# Altium project TP4_COMPACT_FMC.PrjPcb
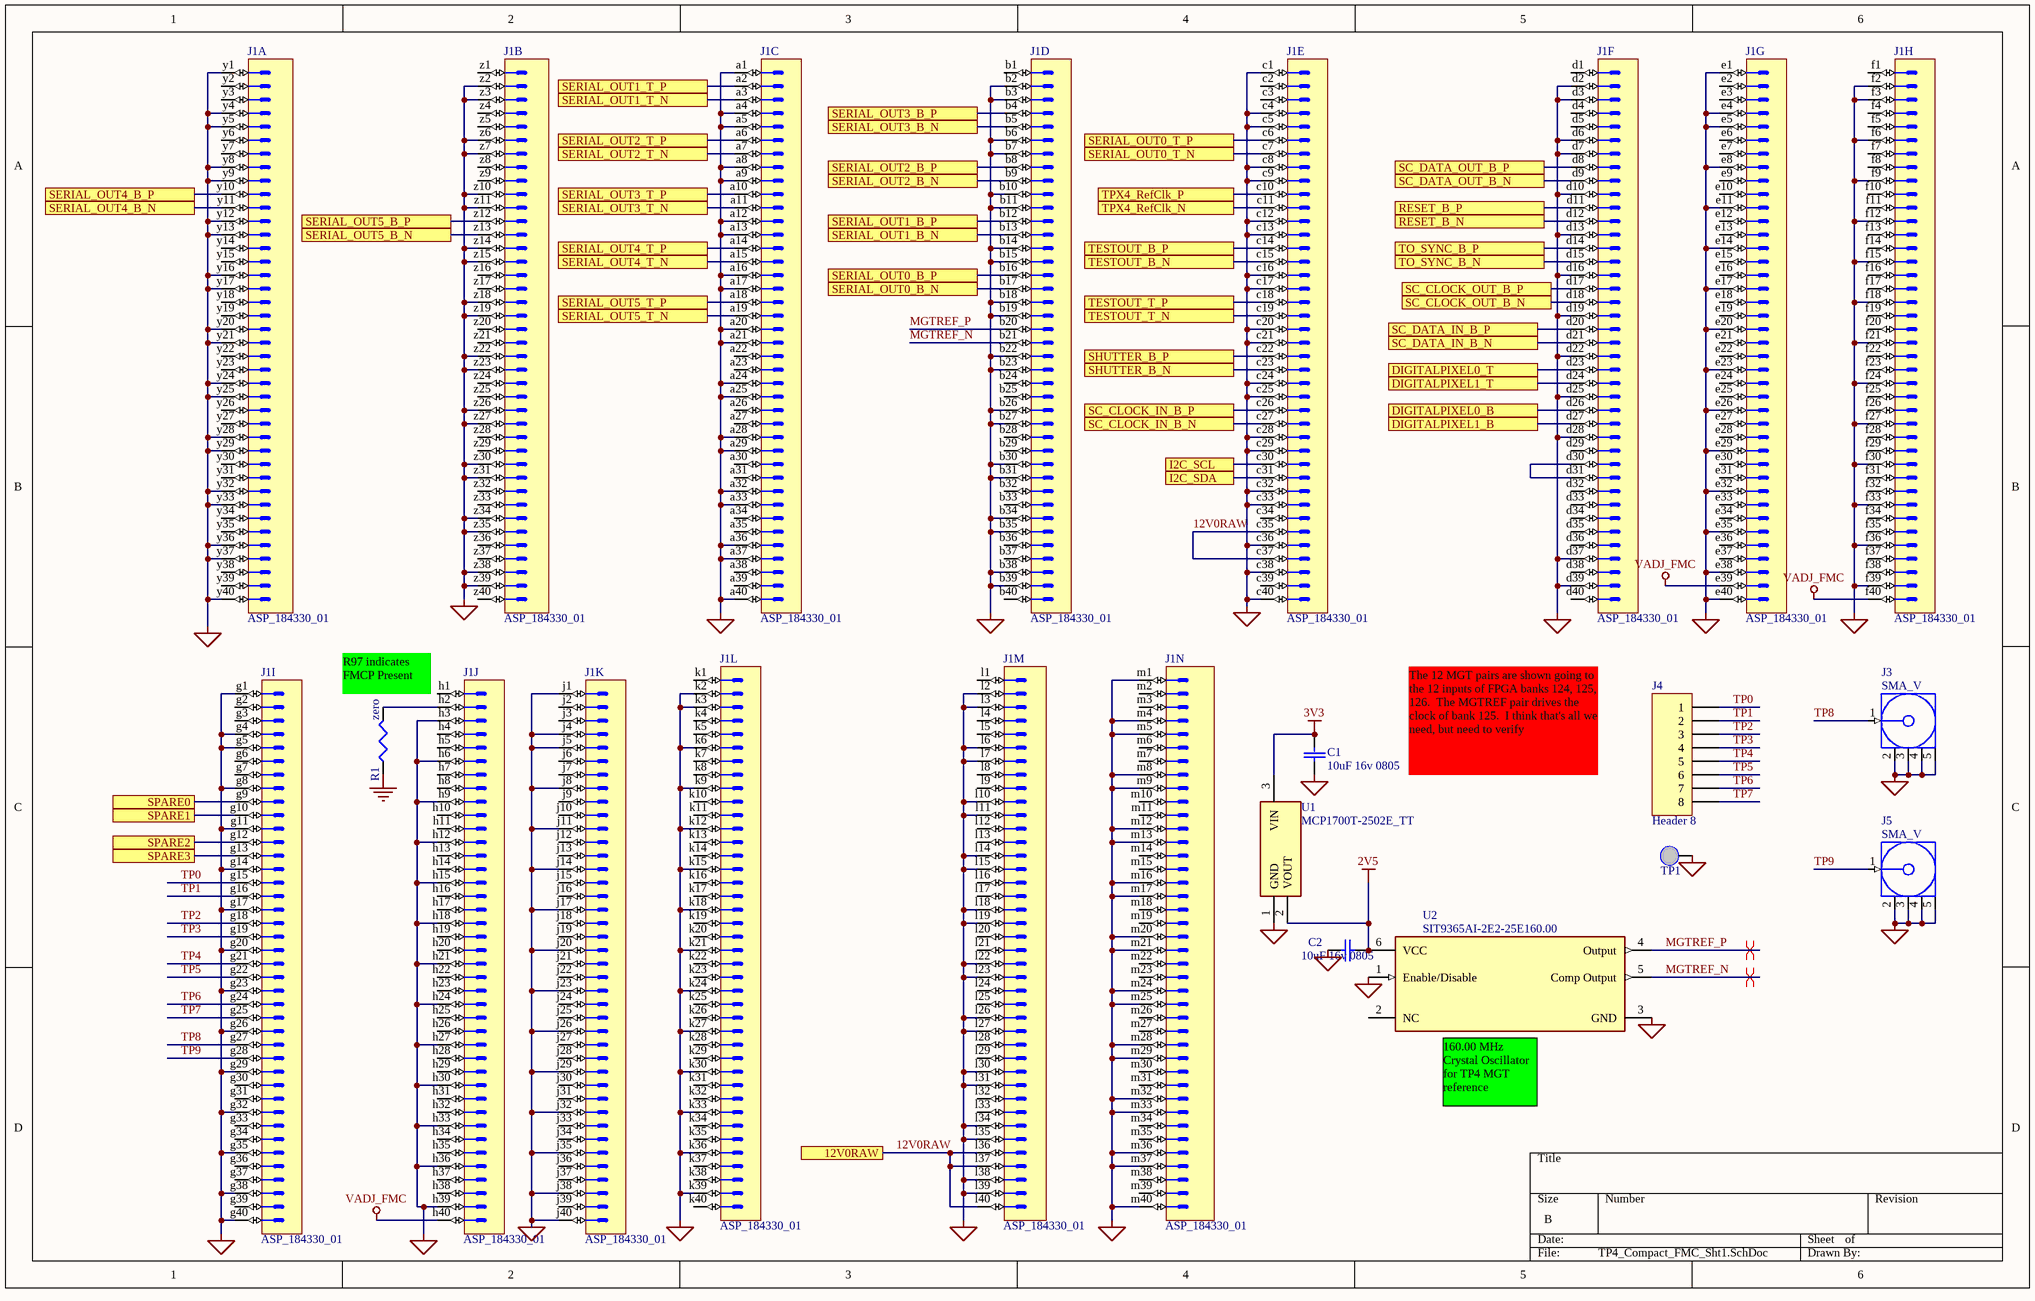
[diagram p0: TP4_Compact_FMC_Sht1.SchDoc]
2 sheets, 53 parts. Net scope: flat (ports and power ports of the same name join across sheets).
Board file: PCB1.PcbDoc
Sheets:
  TP4_Compact_FMC_Sht1.SchDoc
  TP4_Compact_FMC_Sht2.SchDoc

## Sheet TP4_Compact_FMC_Sht1.SchDoc
size B; SheetNumber: 1; SheetTotal: 2

### Parts
C1  value 10uF 16v 0805  [CAP0805]  (hidden comment: Cap)
C2  value 10uF 16v 0805  [CAP0805]  (hidden comment: Cap)
J1  ASP_184330_01  [SAMTEC_ASP_184330_01]  (parts A,B,C,D,E,F,G,H,I,J,K,L,M,N of 14)
J3  SMA_V  [SMA_Vert]
J4  Header 8  [HDR1X8]
J5  SMA_V  [SMA_Vert]
R1  value zero  [CAP0805]  (hidden comment: Res)
TP1  through-hole pad  [Pin1]  (value not drawn)
U1  MCP1700T-2502E_TT  [SOT95P237X112-3N]
U2  SIT9365AI-2E2-25E160.00  [osc_7mm_5mm]

### Ports
12V0RAW (see TP4_Compact_FMC_Sht2[1A]), DIGITALPIXEL0_B (see TP4_Compact_FMC_Sht2[6B]), DIGITALPIXEL0_T (see TP4_Compact_FMC_Sht2[6B]), DIGITALPIXEL1_B (see TP4_Compact_FMC_Sht2[6B]), DIGITALPIXEL1_T (see TP4_Compact_FMC_Sht2[6B]), I2C_SCL (see TP4_Compact_FMC_Sht2[4C]), I2C_SDA (see TP4_Compact_FMC_Sht2[6C]), RESET_B_N (see TP4_Compact_FMC_Sht2[4B]), RESET_B_P (see TP4_Compact_FMC_Sht2[4B]), SC_CLOCK_IN_B_N (see TP4_Compact_FMC_Sht2[4B]), SC_CLOCK_IN_B_P (see TP4_Compact_FMC_Sht2[4B]), SC_CLOCK_OUT_B_N (see TP4_Compact_FMC_Sht2[6B]), SC_CLOCK_OUT_B_P (see TP4_Compact_FMC_Sht2[6B]), SC_DATA_IN_B_N (see TP4_Compact_FMC_Sht2[6B]), SC_DATA_IN_B_P (see TP4_Compact_FMC_Sht2[6B]), SC_DATA_OUT_B_N (see TP4_Compact_FMC_Sht2[4B]), SC_DATA_OUT_B_P (see TP4_Compact_FMC_Sht2[4B]), SERIAL_OUT0_B_N (see TP4_Compact_FMC_Sht2[4A]), SERIAL_OUT0_B_P (see TP4_Compact_FMC_Sht2[4A]), SERIAL_OUT0_T_N (see TP4_Compact_FMC_Sht2[4A]), SERIAL_OUT0_T_P (see TP4_Compact_FMC_Sht2[4A]), SERIAL_OUT1_B_N (see TP4_Compact_FMC_Sht2[6A]), SERIAL_OUT1_B_P (see TP4_Compact_FMC_Sht2[6A]), SERIAL_OUT1_T_N (see TP4_Compact_FMC_Sht2[4A]), SERIAL_OUT1_T_P (see TP4_Compact_FMC_Sht2[4A]), SERIAL_OUT2_B_N (see TP4_Compact_FMC_Sht2[4A]), SERIAL_OUT2_B_P (see TP4_Compact_FMC_Sht2[4A]), SERIAL_OUT2_T_N (see TP4_Compact_FMC_Sht2[6A]), SERIAL_OUT2_T_P (see TP4_Compact_FMC_Sht2[6A]), SERIAL_OUT3_B_N (see TP4_Compact_FMC_Sht2[4A]), SERIAL_OUT3_B_P (see TP4_Compact_FMC_Sht2[4A]), SERIAL_OUT3_T_N (see TP4_Compact_FMC_Sht2[4A]), SERIAL_OUT3_T_P (see TP4_Compact_FMC_Sht2[4A]), SERIAL_OUT4_B_N (see TP4_Compact_FMC_Sht2[6A]), SERIAL_OUT4_B_P (see TP4_Compact_FMC_Sht2[6A]), SERIAL_OUT4_T_N (see TP4_Compact_FMC_Sht2[6A]), SERIAL_OUT4_T_P (see TP4_Compact_FMC_Sht2[6A]), SERIAL_OUT5_B_N (see TP4_Compact_FMC_Sht2[6A]), SERIAL_OUT5_B_P (see TP4_Compact_FMC_Sht2[6A]), SERIAL_OUT5_T_N (see TP4_Compact_FMC_Sht2[6A]), SERIAL_OUT5_T_P (see TP4_Compact_FMC_Sht2[6A]), SHUTTER_B_N (see TP4_Compact_FMC_Sht2[6B]), SHUTTER_B_P (see TP4_Compact_FMC_Sht2[6B]), SPARE0 (see TP4_Compact_FMC_Sht2[6B]), SPARE1 (see TP4_Compact_FMC_Sht2[6B]), SPARE2 (see TP4_Compact_FMC_Sht2[6B]), SPARE3 (see TP4_Compact_FMC_Sht2[6B]), TESTOUT_B_N (see TP4_Compact_FMC_Sht2[4B]), TESTOUT_B_P (see TP4_Compact_FMC_Sht2[4B]), TESTOUT_T_N (see TP4_Compact_FMC_Sht2[4B]), TESTOUT_T_P (see TP4_Compact_FMC_Sht2[4B]), TO_SYNC_B_N (see TP4_Compact_FMC_Sht2[4B]), TO_SYNC_B_P (see TP4_Compact_FMC_Sht2[4B]), TPX4_RefClk_N (see TP4_Compact_FMC_Sht2[4B]), TPX4_RefClk_P (see TP4_Compact_FMC_Sht2[4B])

### Nets
2V5: C2.1 U1.2(VOUT) U2.6(VCC)
3V3: C1.1 U1.3(VIN)
GND: C1.2 C2.2 J1.a1 J1.a4 J1.a5 J1.a8 J1.a9 J1.a12 J1.a13 J1.a16 J1.a17 J1.a20 J1.a21 J1.a24 J1.a25 J1.a28 J1.a29 J1.a32 J1.a33 J1.a36 J1.a37 J1.a40 J1.b2 J1.b3 J1.b6 J1.b7 J1.b10 J1.b11 J1.b14 J1.b15 J1.b18 J1.b19 J1.b22 J1.b23 J1.b26 J1.b27 J1.b30 J1.b31 J1.b34 J1.b35 J1.b38 J1.b39 J1.c1 J1.c4 J1.c5 J1.c8 J1.c9 J1.c12 J1.c13 J1.c16 J1.c17 J1.c20 J1.c21 J1.c24 J1.c25 J1.c28 J1.c29 J1.c32 J1.c33 J1.c36 J1.c38 J1.c40 J1.d2 J1.d3 J1.d6 J1.d7 J1.d10 J1.d13 J1.d16 J1.d19 J1.d22 J1.d25 J1.d28 J1.d37 J1.d39 J1.e1 J1.e4 J1.e5 J1.e8 J1.e11 J1.e14 J1.e17 J1.e20 J1.e23 J1.e26 J1.e29 J1.e32 J1.e35 J1.e38 J1.e40 J1.f2 J1.f3 J1.f6 J1.f9 J1.f12 J1.f15 J1.f18 J1.f21 J1.f24 J1.f27 J1.f30 J1.f33 J1.f36 J1.f39 J1.g1 J1.g4 J1.g5 J1.g8 J1.g11 J1.g14 J1.g17 J1.g20 J1.g23 J1.g26 J1.g29 J1.g32 J1.g35 J1.g38 J1.g40 J1.h3 J1.h6 J1.h9 J1.h12 J1.h15 J1.h18 J1.h21 J1.h24 J1.h27 J1.h30 J1.h33 J1.h36 J1.h39 J1.j1 J1.j4 J1.j5 J1.j8 J1.j11 J1.j14 J1.j17 J1.j20 J1.j23 J1.j26 J1.j29 J1.j32 J1.j35 J1.j38 J1.j40 J1.k2 J1.k3 J1.k6 J1.k9 J1.k12 J1.k15 J1.k18 J1.k21 J1.k24 J1.k27 J1.k30 J1.k33 J1.k36 J1.k39 J1.l2 J1.l3 J1.l6 J1.l7 J1.l10 J1.l11 J1.l14 J1.l15 J1.l18 J1.l19 J1.l22 J1.l23 J1.l26 J1.l27 J1.l30 J1.l31 J1.l34 J1.l35 J1.l38 J1.l39 J1.m1 J1.m4 J1.m5 J1.m8 J1.m9 J1.m12 J1.m13 J1.m16 J1.m17 J1.m20 J1.m21 J1.m24 J1.m25 J1.m28 J1.m29 J1.m32 J1.m33 J1.m36 J1.m37 J1.m40 J1.y1 J1.y4 J1.y5 J1.y8 J1.y9 J1.y12 J1.y13 J1.y16 J1.y17 J1.y20 J1.y21 J1.y24 J1.y25 J1.y28 J1.y29 J1.y32 J1.y33 J1.y36 J1.y37 J1.y40 J1.z2 J1.z3 J1.z6 J1.z7 J1.z10 J1.z11 J1.z14 J1.z15 J1.z18 J1.z19 J1.z22 J1.z23 J1.z26 J1.z27 J1.z30 J1.z31 J1.z34 J1.z35 J1.z38 J1.z39 J3.2(GND) J3.3(GND) J3.4(GND) J3.5(GND) J5.2(GND) J5.3(GND) J5.4(GND) J5.5(GND) R1.1 TP1.1 U1.1(GND) U2.1(Enable/Disable) U2.3(GND)
VADJ_FMC: J1.e39 J1.f40 J1.h40
12V0RAW: J1.c35 J1.c37 J1.l36 J1.l37 J1.l40 ; port 12V0RAW
DIGITALPIXEL0_B: J1.d26 ; port DIGITALPIXEL0_B
DIGITALPIXEL0_T: J1.d23 ; port DIGITALPIXEL0_T
DIGITALPIXEL1_B: J1.d27 ; port DIGITALPIXEL1_B
DIGITALPIXEL1_T: J1.d24 ; port DIGITALPIXEL1_T
I2C_SCL: J1.c30 ; port I2C_SCL
I2C_SDA: J1.c31 ; port I2C_SDA
MGTREF_N: J1.b21 U2.5(Comp_Output)
MGTREF_P: J1.b20 U2.4(Output)
RESET_B_N: J1.d12 ; port RESET_B_N
RESET_B_P: J1.d11 ; port RESET_B_P
SC_CLOCK_IN_B_N: J1.c27 ; port SC_CLOCK_IN_B_N
SC_CLOCK_IN_B_P: J1.c26 ; port SC_CLOCK_IN_B_P
SC_CLOCK_OUT_B_N: J1.d18 ; port SC_CLOCK_OUT_B_N
SC_CLOCK_OUT_B_P: J1.d17 ; port SC_CLOCK_OUT_B_P
SC_DATA_IN_B_N: J1.d21 ; port SC_DATA_IN_B_N
SC_DATA_IN_B_P: J1.d20 ; port SC_DATA_IN_B_P
SC_DATA_OUT_B_N: J1.d9 ; port SC_DATA_OUT_B_N
SC_DATA_OUT_B_P: J1.d8 ; port SC_DATA_OUT_B_P
SERIAL_OUT0_B_N: J1.b17 ; port SERIAL_OUT0_B_N
SERIAL_OUT0_B_P: J1.b16 ; port SERIAL_OUT0_B_P
SERIAL_OUT0_T_N: J1.c7 ; port SERIAL_OUT0_T_N
SERIAL_OUT0_T_P: J1.c6 ; port SERIAL_OUT0_T_P
SERIAL_OUT1_B_N: J1.b13 ; port SERIAL_OUT1_B_N
SERIAL_OUT1_B_P: J1.b12 ; port SERIAL_OUT1_B_P
SERIAL_OUT1_T_N: J1.a3 ; port SERIAL_OUT1_T_N
SERIAL_OUT1_T_P: J1.a2 ; port SERIAL_OUT1_T_P
SERIAL_OUT2_B_N: J1.b9 ; port SERIAL_OUT2_B_N
SERIAL_OUT2_B_P: J1.b8 ; port SERIAL_OUT2_B_P
SERIAL_OUT2_T_N: J1.a7 ; port SERIAL_OUT2_T_N
SERIAL_OUT2_T_P: J1.a6 ; port SERIAL_OUT2_T_P
SERIAL_OUT3_B_N: J1.b5 ; port SERIAL_OUT3_B_N
SERIAL_OUT3_B_P: J1.b4 ; port SERIAL_OUT3_B_P
SERIAL_OUT3_T_N: J1.a11 ; port SERIAL_OUT3_T_N
SERIAL_OUT3_T_P: J1.a10 ; port SERIAL_OUT3_T_P
SERIAL_OUT4_B_N: J1.y11 ; port SERIAL_OUT4_B_N
SERIAL_OUT4_B_P: J1.y10 ; port SERIAL_OUT4_B_P
SERIAL_OUT4_T_N: J1.a15 ; port SERIAL_OUT4_T_N
SERIAL_OUT4_T_P: J1.a14 ; port SERIAL_OUT4_T_P
SERIAL_OUT5_B_N: J1.z13 ; port SERIAL_OUT5_B_N
SERIAL_OUT5_B_P: J1.z12 ; port SERIAL_OUT5_B_P
SERIAL_OUT5_T_N: J1.a19 ; port SERIAL_OUT5_T_N
SERIAL_OUT5_T_P: J1.a18 ; port SERIAL_OUT5_T_P
SHUTTER_B_N: J1.c23 ; port SHUTTER_B_N
SHUTTER_B_P: J1.c22 ; port SHUTTER_B_P
SPARE0: J1.g9 ; port SPARE0
SPARE1: J1.g10 ; port SPARE1
SPARE2: J1.g12 ; port SPARE2
SPARE3: J1.g13 ; port SPARE3
TESTOUT_B_N: J1.c15 ; port TESTOUT_B_N
TESTOUT_B_P: J1.c14 ; port TESTOUT_B_P
TESTOUT_T_N: J1.c19 ; port TESTOUT_T_N
TESTOUT_T_P: J1.c18 ; port TESTOUT_T_P
TO_SYNC_B_N: J1.d15 ; port TO_SYNC_B_N
TO_SYNC_B_P: J1.d14 ; port TO_SYNC_B_P
TP0: J1.g15 J4.1
TP1: J1.g16 J4.2
TP2: J1.g18 J4.3
TP3: J1.g19 J4.4
TP4: J1.g21 J4.5
TP5: J1.g22 J4.6
TP6: J1.g24 J4.7
TP7: J1.g25 J4.8
TP8: J1.g27 J3.1(Signal)
TP9: J1.g28 J5.1(Signal)
TPX4_RefClk_N: J1.c11 ; port TPX4_RefClk_N
TPX4_RefClk_P: J1.c10 ; port TPX4_RefClk_P
NetJ1_d30: J1.d30 J1.d31
NetJ1_h2: J1.h2 R1.2

Not connected (* = marked no-connect by the designer): J1 a22 a23 a26 a27 a30 a31 a34 a35 a38 a39 b1 b24 b25 b28 b29 b32 b33 b36 b37 b40 c2 c3 c34 c39 d1 d4 d5 d29 d32 d33 d34 d35 d36 d38 d40 e2 e3 e6 e7 e9 e10 e12 e13 e15 e16 e18 e19 e21 e22 e24 e25 e27 e28 e30 e31 e33 e34 e36 e37 f1 f4 f5 f7 f8 f10 f11 f13 f14 f16 f17 f19 f20 f22 f23 f25 f26 f28 f29 f31 f32 f34 f35 f37 f38 g2 g3 g6 g7 g30 g31 g33 g34 g36 g37 g39 h1 h4 h5 h7 h8 h10 h11 h13 h14 h16 h17 h19 h20 h22 h23 h25 h26 h28 h29 h31 h32 h34 h35 h37 h38 j2 j3 j6 j7 j9 j10 j12 j13 j15 j16 j18 j19 j21 j22 j24 j25 j27 j28 j30 j31 j33 j34 j36 j37 j39 k1 k4 k5 k7 k8 k10 k11 k13 k14 k16 k17 k19 k20 k22 k23 k25 k26 k28 k29 k31 k32 k34 k35 k37 k38 k40 l1 l4 l5 l8 l9 l12 l13 l16 l17 l20 l21 l24 l25 l28 l29 l32 l33 m2 m3 m6 m7 m10 m11 m14 m15 m18 m19 m22 m23 m26 m27 m30 m31 m34 m35 m38 m39 y2 y3 y6 y7 y14 y15 y18 y19 y22 y23 y26 y27 y30 y31 y34 y35 y38 y39 z1 z4 z5 z8 z9 z16 z17 z20 z21 z24 z25 z28 z29 z32 z33 z36 z37 z40; U2 2(NC)

### Layout directives
differential pair: MGTREF_N, MGTREF_P

### Notes on the sheet
- R97 indicates FMCP Present
- The 12 MGT pairs are shown going to the 12 inputs of FPGA banks 124, 125, 126.  The MGTREF pair drives the clock of bank 125.  I think that's all we need, but need to verify
- (near U2) 160.00 MHz Crystal Oscillator for TP4 MGT reference

### Library data of the parts
C1 C2 = Cap: Capacitor, ceramic SM; OrderNo: 1276-2872-1-ND; CostEach: 0; Supplier: Digikey
J1 = FMCplus: CostEach: 0; OrderNo: SAM9173-ND; Supplier: Digikey
J3 J5 = COAX-F: Vertical mount SMA; PCB_Layout: Complies with manufacturer's recommendation.; DrillSize: Corresponds to nominal value.; OrderNo: SAM10718-ND; Published: 15-Jul-2004; LatestRevisionDate: 15-Jul-2004; LatestRevisionNote: Component Replaced.; DatasheetDocument: 30-May-2003; PackageDocument: 04-Jul-1999; PackageReference: 919-119J-51AX; Publisher: Altium Limited; ComponentLink1Description: Manufacturer Link; ComponentLink1URL: http://www.amphenolrf.com/
J4 = Header 8: Header, 8-Pin; LatestRevisionDate: 17-Jul-2002; LatestRevisionNote: Re-released for DXP Platform.; Publisher: Altium Limited
R1 = Res3: Resistor; OrderNo: P0.0GCT; CostEach: 0; Published: 8-Jun-2000; LatestRevisionDate: 29-May-2009; LatestRevisionNote: IPC-7351 Footprint Added.; PackageReference: J1-0603; Publisher: Altium Limited; PackageDescription: Chip Resistor; Supplier: Digikey
TP1 = testpoint: EM_PN: DNP; Supplier: Digikey
U1 = MCP1700T-2502E_TT: Integrated Circuit; Manufacturer_Name: Microchip; Manufacturer_Part_Number: MCP1700T-2502E/TT; OrderNo: MCP1700T-2502E/TTCT-ND; Datasheet Link: https://datasheet.datasheetarchive.com/originals/distributors/Datasheets-DGA25/1767215.pdf; Height: 1.12mm; Mouser Part Number: 579-MCP1700T2502E/TT; Mouser Price/Stock: https://www.mouser.co.uk/ProductDetail/Microchip-Technology/MCP1700T-2502E-TT?qs=fM4xO01eazNo%2FPEFFkh6Nw%3D%3D; Arrow Part Number: MCP1700T-2502E/TT; Arrow Price/Stock: https://www.arrow.com/en/products/mcp1700t-2502ett/microchip-technology?utm_currency=USD&region=nac
U2 = CCLD-033-50-100.000: OrderNo: 1473-SIT9365AI-2E2-25E160.000000-ND; Supplier: Digikey

## Sheet TP4_Compact_FMC_Sht2.SchDoc
size B; SheetNumber: 2; SheetTotal: 2
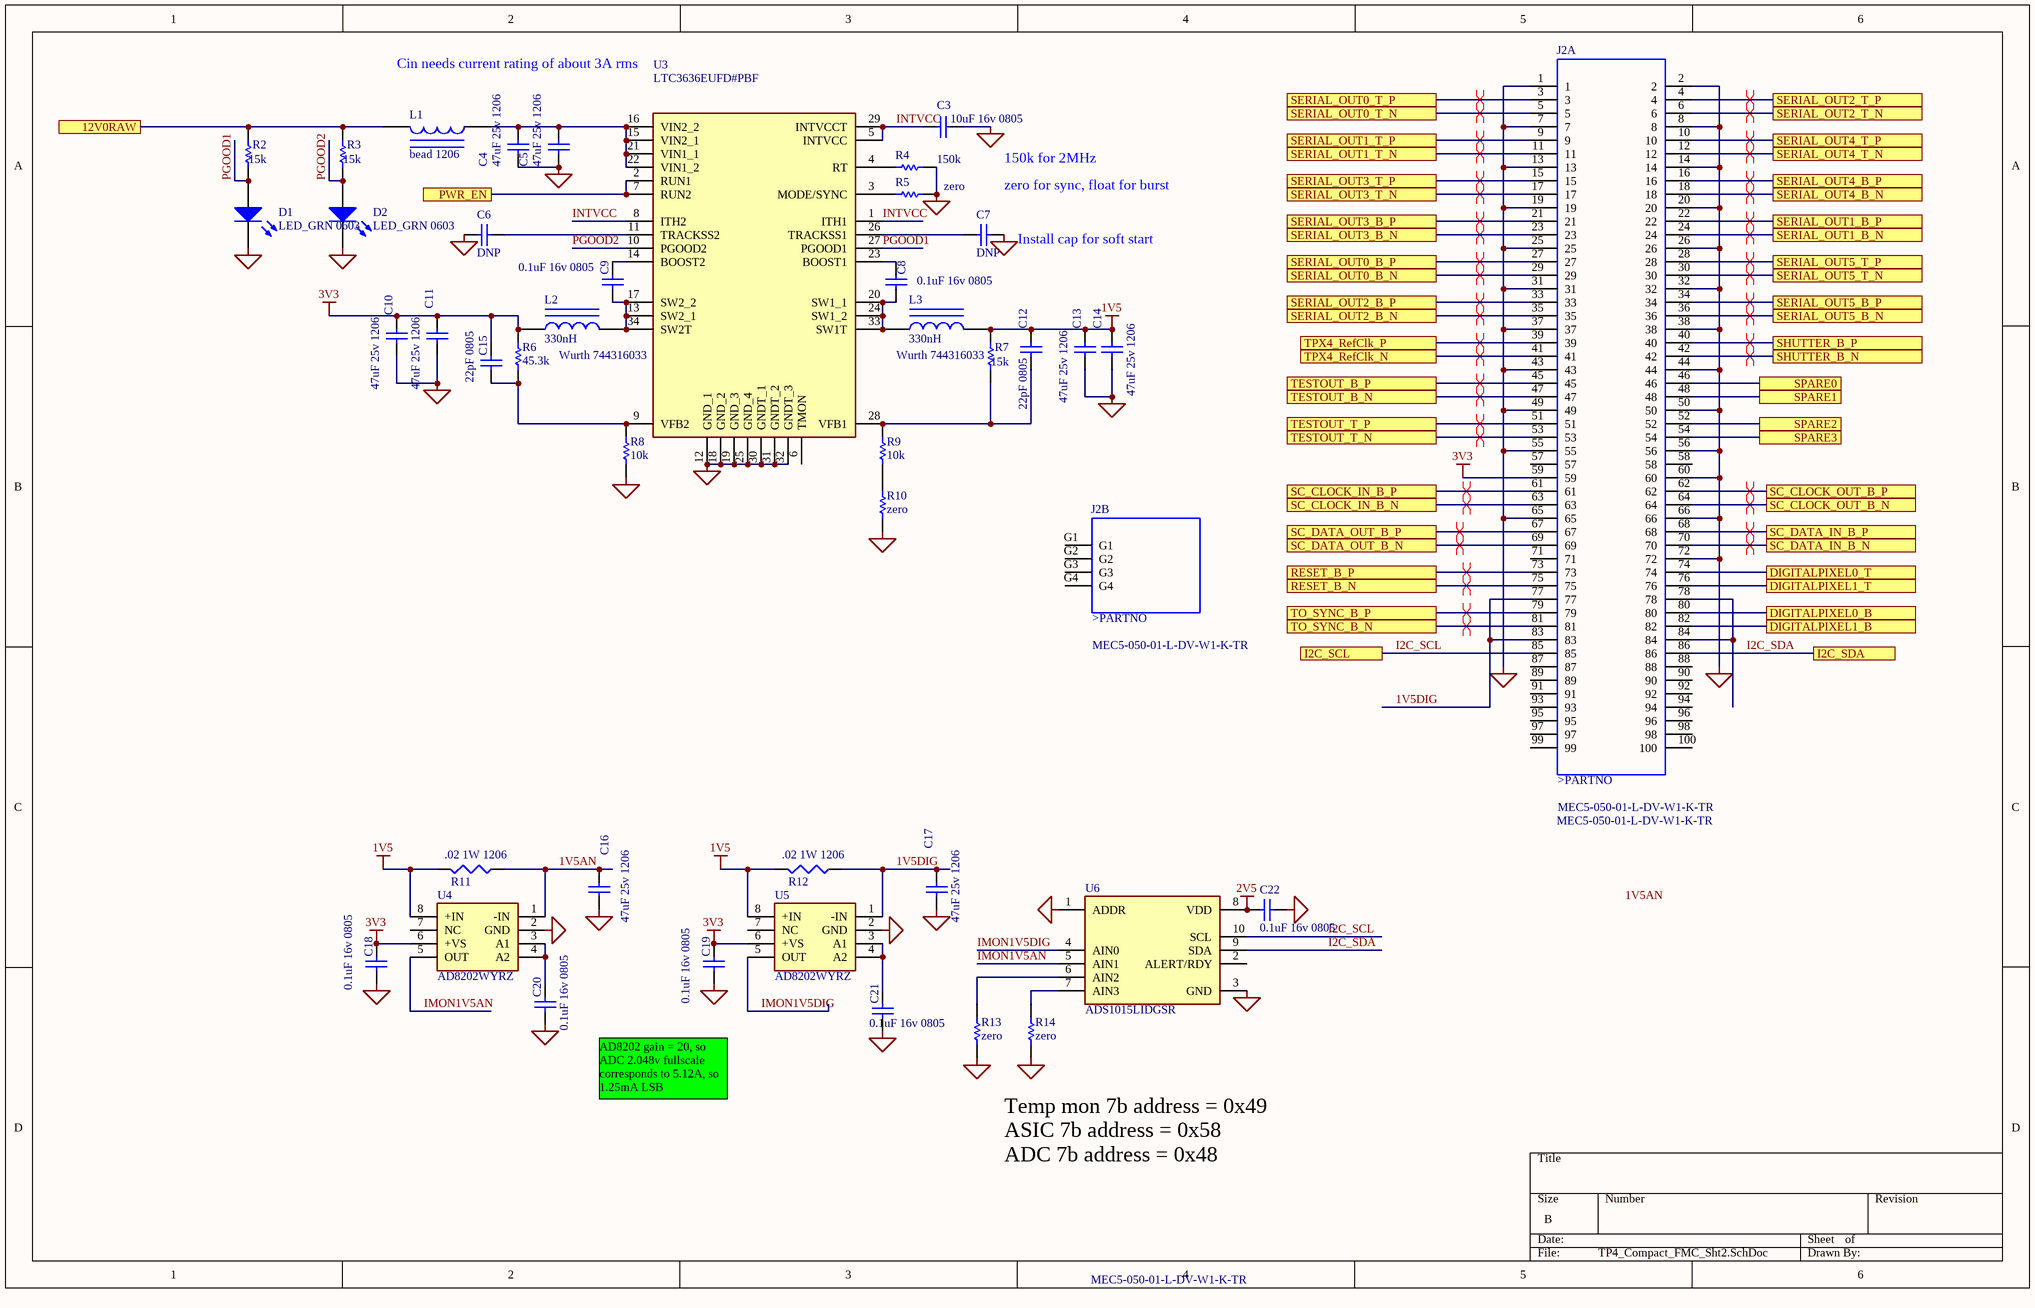
[diagram p1: TP4_Compact_FMC_Sht2.SchDoc]

### Parts
C3  value 10uF 16v 0805  [CAP0805]  (hidden comment: Cap)
C4  value 47uF 25v 1206  [1206]  (hidden comment: Cap)
C5  value 47uF 25v 1206  [1206]  (hidden comment: Cap)
C6  value DNP  [CAP0805]  (hidden comment: Cap)
C7  value DNP  [CAP0805]  (hidden comment: Cap)
C8  value 0.1uF 16v 0805  [CAP0805]  (hidden comment: Cap)
C9  value 0.1uF 16v 0805  [CAP0805]  (hidden comment: Cap)
C10  value 47uF 25v 1206  [1206]  (hidden comment: Cap)
C11  value 47uF 25v 1206  [1206]  (hidden comment: Cap)
C12  value 22pF 0805  [CAP0805]  (hidden comment: Cap)
C13  value 47uF 25v 1206  [1206]  (hidden comment: Cap)
C14  value 47uF 25v 1206  [1206]  (hidden comment: Cap)
C15  value 22pF 0805  [CAP0805]  (hidden comment: Cap)
C16  value 47uF 25v 1206  [1206]  (hidden comment: Cap)
C17  value 47uF 25v 1206  [1206]  (hidden comment: Cap)
C18  value 0.1uF 16v 0805  [CAP0805]  (hidden comment: Cap)
C19  value 0.1uF 16v 0805  [CAP0805]  (hidden comment: Cap)
C20  value 0.1uF 16v 0805  [CAP0805]  (hidden comment: Cap)
C21  value 0.1uF 16v 0805  [CAP0805]  (hidden comment: Cap)
C22  value 0.1uF 16v 0805  [CAP0805]  (hidden comment: Cap)
D1  LED_GRN 0603  [LED0603]
D2  LED_GRN 0603  [LED0603]
J2  MEC5-050-01-L-DV-W1-K-TR  [MEC5-050-01-L-DV-W1-K-TR]  (parts A,B of 2)
L1  value bead 1206  [1206]  (hidden comment: Inductor Iron)
L2  Wurth 744316033  value 330nH  [Inductor_5.6mm]
L3  Wurth 744316033  value 330nH  [Inductor_5.6mm]
R2  value 15k  [CAP0805]  (hidden comment: Res1)
R3  value 15k  [CAP0805]  (hidden comment: Res1)
R4  value 150k  [CAP0805]  (hidden comment: Res1)
R5  value zero  [CAP0805]  (hidden comment: Res1)
R6  value 45.3k  [CAP0805]  (hidden comment: Res1)
R7  value 15k  [CAP0805]  (hidden comment: Res1)
R8  value 10k  [CAP0805]  (hidden comment: Res1)
R9  value 10k  [CAP0805]  (hidden comment: Res1)
R10  value zero  [CAP0805]  (hidden comment: Res1)
R11  value .02 1W 1206  [CAP0805]  (hidden comment: Res)
R12  value .02 1W 1206  [CAP0805]  (hidden comment: Res)
R13  value zero  [CAP0805]  (hidden comment: Res1)
R14  value zero  [CAP0805]  (hidden comment: Res1)
U3  LTC3636EUFD#PBF  [LTC3636EUFDPBF]
U4  AD8202WYRZ  [SOIC127P600X175-8N]
U5  AD8202WYRZ  [SOIC127P600X175-8N]
U6  ADS1015LIDGSR  [SOP50P490X110-10N]

### Ports
12V0RAW (see TP4_Compact_FMC_Sht1[3D]), DIGITALPIXEL0_B (see TP4_Compact_FMC_Sht1[5B]), DIGITALPIXEL0_T (see TP4_Compact_FMC_Sht1[5B]), DIGITALPIXEL1_B (see TP4_Compact_FMC_Sht1[5B]), DIGITALPIXEL1_T (see TP4_Compact_FMC_Sht1[5B]), I2C_SCL (see TP4_Compact_FMC_Sht1[4B]), I2C_SDA (see TP4_Compact_FMC_Sht1[4B]), PWR_EN, RESET_B_N (see TP4_Compact_FMC_Sht1[5A]), RESET_B_P (see TP4_Compact_FMC_Sht1[5A]), SC_CLOCK_IN_B_N (see TP4_Compact_FMC_Sht1[4B]), SC_CLOCK_IN_B_P (see TP4_Compact_FMC_Sht1[4B]), SC_CLOCK_OUT_B_N (see TP4_Compact_FMC_Sht1[5A]), SC_CLOCK_OUT_B_P (see TP4_Compact_FMC_Sht1[5A]), SC_DATA_IN_B_N (see TP4_Compact_FMC_Sht1[5B]), SC_DATA_IN_B_P (see TP4_Compact_FMC_Sht1[5B]), SC_DATA_OUT_B_N (see TP4_Compact_FMC_Sht1[5A]), SC_DATA_OUT_B_P (see TP4_Compact_FMC_Sht1[5A]), SERIAL_OUT0_B_N (see TP4_Compact_FMC_Sht1[3A]), SERIAL_OUT0_B_P (see TP4_Compact_FMC_Sht1[3A]), SERIAL_OUT0_T_N (see TP4_Compact_FMC_Sht1[4A]), SERIAL_OUT0_T_P (see TP4_Compact_FMC_Sht1[4A]), SERIAL_OUT1_B_N (see TP4_Compact_FMC_Sht1[3A]), SERIAL_OUT1_B_P (see TP4_Compact_FMC_Sht1[3A]), SERIAL_OUT1_T_N (see TP4_Compact_FMC_Sht1[2A]), SERIAL_OUT1_T_P (see TP4_Compact_FMC_Sht1[2A]), SERIAL_OUT2_B_N (see TP4_Compact_FMC_Sht1[3A]), SERIAL_OUT2_B_P (see TP4_Compact_FMC_Sht1[3A]), SERIAL_OUT2_T_N (see TP4_Compact_FMC_Sht1[2A]), SERIAL_OUT2_T_P (see TP4_Compact_FMC_Sht1[2A]), SERIAL_OUT3_B_N (see TP4_Compact_FMC_Sht1[3A]), SERIAL_OUT3_B_P (see TP4_Compact_FMC_Sht1[3A]), SERIAL_OUT3_T_N (see TP4_Compact_FMC_Sht1[2A]), SERIAL_OUT3_T_P (see TP4_Compact_FMC_Sht1[2A]), SERIAL_OUT4_B_N (see TP4_Compact_FMC_Sht1[1A]), SERIAL_OUT4_B_P (see TP4_Compact_FMC_Sht1[1A]), SERIAL_OUT4_T_N (see TP4_Compact_FMC_Sht1[2A]), SERIAL_OUT4_T_P (see TP4_Compact_FMC_Sht1[2A]), SERIAL_OUT5_B_N (see TP4_Compact_FMC_Sht1[1A]), SERIAL_OUT5_B_P (see TP4_Compact_FMC_Sht1[1A]), SERIAL_OUT5_T_N (see TP4_Compact_FMC_Sht1[2A]), SERIAL_OUT5_T_P (see TP4_Compact_FMC_Sht1[2A]), SHUTTER_B_N (see TP4_Compact_FMC_Sht1[4B]), SHUTTER_B_P (see TP4_Compact_FMC_Sht1[4B]), SPARE0 (see TP4_Compact_FMC_Sht1[1C]), SPARE1 (see TP4_Compact_FMC_Sht1[1C]), SPARE2 (see TP4_Compact_FMC_Sht1[1C]), SPARE3 (see TP4_Compact_FMC_Sht1[1C]), TESTOUT_B_N (see TP4_Compact_FMC_Sht1[4A]), TESTOUT_B_P (see TP4_Compact_FMC_Sht1[4A]), TESTOUT_T_N (see TP4_Compact_FMC_Sht1[4A]), TESTOUT_T_P (see TP4_Compact_FMC_Sht1[4A]), TO_SYNC_B_N (see TP4_Compact_FMC_Sht1[5A]), TO_SYNC_B_P (see TP4_Compact_FMC_Sht1[5A]), TPX4_RefClk_N (see TP4_Compact_FMC_Sht1[4A]), TPX4_RefClk_P (see TP4_Compact_FMC_Sht1[4A])

### Nets
1V5: C12.2 C13.2 C14.2 L3.2 R7.2 R11.2 R12.2 U4.8(+IN) U5.8(+IN)
2V5: C22.2 U6.8(VDD)
3V3: C10.2 C11.2 C15.2 C18.2 C19.2 J2.59 L2.1 R6.2 U4.6(+VS) U5.6(+VS)
GND: C3.1 C4.1 C5.1 C6.2 C7.1 C10.1 C11.1 C13.1 C14.1 C16.1 C17.1 C18.1 C19.1 C20.1 C21.1 C22.1 D1.2(K) D2.2(K) J2.1 J2.2 J2.7 J2.8 J2.13 J2.14 J2.19 J2.20 J2.25 J2.26 J2.31 J2.32 J2.37 J2.38 J2.43 J2.44 J2.49 J2.50 J2.55 J2.56 J2.60 J2.65 J2.66 J2.72 R4.1 R5.1 R8.1 R10.1 R13.1 R14.1 U3.12(GND_1) U3.18(GND_2) U3.19(GND_3) U3.25(GND_4) U3.30(GNDT_1) U3.31(GNDT_2) U3.32(GNDT_3) U4.2(GND) U5.2(GND) U6.1(ADDR) U6.3(GND)
1V5AN: C16.2 R11.1 U4.1(-IN)
1V5DIG: C17.2 J2.77 J2.83 R12.1 U5.1(-IN)
12V0RAW: L1.2 R2.2 R3.2 ; port 12V0RAW
DIGITALPIXEL0_B: J2.80 ; port DIGITALPIXEL0_B
DIGITALPIXEL0_T: J2.74 ; port DIGITALPIXEL0_T
DIGITALPIXEL1_B: J2.82 ; port DIGITALPIXEL1_B
DIGITALPIXEL1_T: J2.76 ; port DIGITALPIXEL1_T
I2C_SCL: J2.85 U6.10(SCL) ; port I2C_SCL
I2C_SDA: J2.86 U6.9(SDA) ; port I2C_SDA
IMON1V5AN: U4.5(OUT) U6.5(AIN1)
IMON1V5DIG: U5.5(OUT) U6.4(AIN0)
INTVCC: C3.2 U3.1(ITH1) U3.5(INTVCC) U3.8(ITH2) U3.29(INTVCCT)
PGOOD1: D1.1(A) R2.1 U3.27(PGOOD1)
PGOOD2: D2.1(A) R3.1 U3.10(PGOOD2)
PWR_EN: U3.2(RUN1) U3.7(RUN2) ; port PWR_EN
RESET_B_N: J2.75 ; port RESET_B_N
RESET_B_P: J2.73 ; port RESET_B_P
SC_CLOCK_IN_B_N: J2.63 ; port SC_CLOCK_IN_B_N
SC_CLOCK_IN_B_P: J2.61 ; port SC_CLOCK_IN_B_P
SC_CLOCK_OUT_B_N: J2.64 ; port SC_CLOCK_OUT_B_N
SC_CLOCK_OUT_B_P: J2.62 ; port SC_CLOCK_OUT_B_P
SC_DATA_IN_B_N: J2.70 ; port SC_DATA_IN_B_N
SC_DATA_IN_B_P: J2.68 ; port SC_DATA_IN_B_P
SC_DATA_OUT_B_N: J2.69 ; port SC_DATA_OUT_B_N
SC_DATA_OUT_B_P: J2.67 ; port SC_DATA_OUT_B_P
SERIAL_OUT0_B_N: J2.29 ; port SERIAL_OUT0_B_N
SERIAL_OUT0_B_P: J2.27 ; port SERIAL_OUT0_B_P
SERIAL_OUT0_T_N: J2.5 ; port SERIAL_OUT0_T_N
SERIAL_OUT0_T_P: J2.3 ; port SERIAL_OUT0_T_P
SERIAL_OUT1_B_N: J2.24 ; port SERIAL_OUT1_B_N
SERIAL_OUT1_B_P: J2.22 ; port SERIAL_OUT1_B_P
SERIAL_OUT1_T_N: J2.11 ; port SERIAL_OUT1_T_N
SERIAL_OUT1_T_P: J2.9 ; port SERIAL_OUT1_T_P
SERIAL_OUT2_B_N: J2.35 ; port SERIAL_OUT2_B_N
SERIAL_OUT2_B_P: J2.33 ; port SERIAL_OUT2_B_P
SERIAL_OUT2_T_N: J2.6 ; port SERIAL_OUT2_T_N
SERIAL_OUT2_T_P: J2.4 ; port SERIAL_OUT2_T_P
SERIAL_OUT3_B_N: J2.23 ; port SERIAL_OUT3_B_N
SERIAL_OUT3_B_P: J2.21 ; port SERIAL_OUT3_B_P
SERIAL_OUT3_T_N: J2.17 ; port SERIAL_OUT3_T_N
SERIAL_OUT3_T_P: J2.15 ; port SERIAL_OUT3_T_P
SERIAL_OUT4_B_N: J2.18 ; port SERIAL_OUT4_B_N
SERIAL_OUT4_B_P: J2.16 ; port SERIAL_OUT4_B_P
SERIAL_OUT4_T_N: J2.12 ; port SERIAL_OUT4_T_N
SERIAL_OUT4_T_P: J2.10 ; port SERIAL_OUT4_T_P
SERIAL_OUT5_B_N: J2.36 ; port SERIAL_OUT5_B_N
SERIAL_OUT5_B_P: J2.34 ; port SERIAL_OUT5_B_P
SERIAL_OUT5_T_N: J2.30 ; port SERIAL_OUT5_T_N
SERIAL_OUT5_T_P: J2.28 ; port SERIAL_OUT5_T_P
SHUTTER_B_N: J2.42 ; port SHUTTER_B_N
SHUTTER_B_P: J2.40 ; port SHUTTER_B_P
SPARE0: J2.46 ; port SPARE0
SPARE1: J2.48 ; port SPARE1
SPARE2: J2.52 ; port SPARE2
SPARE3: J2.54 ; port SPARE3
TESTOUT_B_N: J2.47 ; port TESTOUT_B_N
TESTOUT_B_P: J2.45 ; port TESTOUT_B_P
TESTOUT_T_N: J2.53 ; port TESTOUT_T_N
TESTOUT_T_P: J2.51 ; port TESTOUT_T_P
TO_SYNC_B_N: J2.81 ; port TO_SYNC_B_N
TO_SYNC_B_P: J2.79 ; port TO_SYNC_B_P
TPX4_RefClk_N: J2.41 ; port TPX4_RefClk_N
TPX4_RefClk_P: J2.39 ; port TPX4_RefClk_P
NetC4_2: C4.2 C5.2 L1.1 U3.15(VIN2_1) U3.16(VIN2_2) U3.21(VIN1_1) U3.22(VIN1_2)
NetC6_1: C6.1 U3.11(TRACKSS2)
NetC7_2: C7.2 U3.26(TRACKSS1)
NetC8_1: C8.1 L3.1 U3.20(SW1_1) U3.24(SW1_2) U3.33(SW1T)
NetC8_2: C8.2 U3.23(BOOST1)
NetC9_1: C9.1 L2.2 U3.13(SW2_1) U3.17(SW2_2) U3.34(SW2T)
NetC9_2: C9.2 U3.14(BOOST2)
NetC12_1: C12.1 R7.1 R9.2 U3.28(VFB1)
NetC15_1: C15.1 R6.1 R8.2 U3.9(VFB2)
NetC20_2: C20.2 U4.3(A1) U4.4(A2)
NetC21_2: C21.2 U5.3(A1) U5.4(A2)
NetJ2_78: J2.78 J2.84
NetR4_2: R4.2 U3.4(RT)
NetR5_2: R5.2 U3.3(MODE/SYNC)
NetR9_1: R9.1 R10.2
NetR13_2: R13.2 U6.6(AIN2)
NetR14_2: R14.2 U6.7(AIN3)

Not connected (* = marked no-connect by the designer): J2 57 58 71 87 88 89 90 91 92 93 94 95 96 97 98 99 100 G1 G2 G3 G4; U3 6(TMON); U4 7(NC); U5 7(NC); U6 2(ALERT/RDY)

### Layout directives
differential pair: RESET_B_N, RESET_B_P, SC_CLOCK_IN_B_N, SC_CLOCK_IN_B_P, SC_CLOCK_OUT_B_N, SC_CLOCK_OUT_B_P, SC_DATA_IN_B_N, SC_DATA_IN_B_P, SC_DATA_OUT_B_N, SC_DATA_OUT_B_P, SERIAL_OUT0_B_N, SERIAL_OUT0_B_P, SERIAL_OUT0_T_N, SERIAL_OUT0_T_P, SERIAL_OUT1_B_N, SERIAL_OUT1_B_P, SERIAL_OUT1_T_N, SERIAL_OUT1_T_P, SERIAL_OUT2_B_N, SERIAL_OUT2_B_P, SERIAL_OUT2_T_N, SERIAL_OUT2_T_P, SERIAL_OUT3_B_N, SERIAL_OUT3_B_P, SERIAL_OUT3_T_N, SERIAL_OUT3_T_P, SERIAL_OUT4_B_N, SERIAL_OUT4_B_P, SERIAL_OUT4_T_N, SERIAL_OUT4_T_P, SERIAL_OUT5_B_N, SERIAL_OUT5_B_P, SERIAL_OUT5_T_N, SERIAL_OUT5_T_P, SHUTTER_B_N, SHUTTER_B_P, TESTOUT_B_N, TESTOUT_B_P, TESTOUT_T_N, TESTOUT_T_P, TO_SYNC_B_N, TO_SYNC_B_P, TPX4_RefClk_N, TPX4_RefClk_P

### Notes on the sheet
- Cin needs current rating of about 3A rms
- 150k for 2MHz
- (near C7) zero for sync, float for burst
- (near C7) Install cap for soft start
- AD8202 gain = 20, so ADC 2.048v fullscale corresponds to 5.12A, so 1.25mA LSB
- Temp mon 7b address = 0x49
  ASIC 7b address = 0x58
  ADC 7b address = 0x48
- Labels drawn without touching a wire or pin: 1V5AN
- (in symbol MEC5-050-01-L-DV-W1-K-TR, part A) >PARTNO
- (in symbol MEC5-050-01-L-DV-W1-K-TR, part B) >PARTNO

### Library data of the parts
C3 = Cap: Capacitor; OrderNo: 1276-2872-1-ND; Published: 8-Jun-2000; LatestRevisionDate: 17-Jul-2002; LatestRevisionNote: Re-released for DXP Platform.; PackageReference: RAD-0.3; Publisher: Altium Limited; PackageDescription: Radial Cap, Thru-Hole; 2 Leads; 0.3 in Pin Spacing
C4 C5 C10 C11 C13 C14 C16 C17 = Cap: Capacitor; OrderNo: 445-8047-1-ND; Published: 8-Jun-2000; LatestRevisionDate: 17-Jul-2002; LatestRevisionNote: Re-released for DXP Platform.; PackageReference: RAD-0.3; Publisher: Altium Limited; PackageDescription: Radial Cap, Thru-Hole; 2 Leads; 0.3 in Pin Spacing
C6 C7 = Cap: Capacitor; Published: 8-Jun-2000; LatestRevisionDate: 17-Jul-2002; LatestRevisionNote: Re-released for DXP Platform.; PackageReference: RAD-0.3; Publisher: Altium Limited; PackageDescription: Radial Cap, Thru-Hole; 2 Leads; 0.3 in Pin Spacing
C8 C9 C18-C22 = Cap: Capacitor; OrderNo: 399-C0805C104K4RACTUCT-ND; CostEach: 0; Published: 8-Jun-2000; LatestRevisionDate: 17-Jul-2002; LatestRevisionNote: Re-released for DXP Platform.; PackageReference: RAD-0.3; Publisher: Altium Limited; PackageDescription: Radial Cap, Thru-Hole; 2 Leads; 0.3 in Pin Spacing; Supplier: Digikey
C12 C15 = Cap: Capacitor; OrderNo: 399-C0805C220J5GACTUCT-ND; Published: 8-Jun-2000; LatestRevisionDate: 17-Jul-2002; LatestRevisionNote: Re-released for DXP Platform.; PackageReference: RAD-0.3; Publisher: Altium Limited; PackageDescription: Radial Cap, Thru-Hole; 2 Leads; 0.3 in Pin Spacing
D1 D2 = LED2: Red LED, SM; EM_PN: L62301CT-ND; OrderNo: L62305CT-ND; Supplier: Digikey
J2 = MEC5-050-01-L-DV-W1-K-TR: MF: Samtec; Package: None; MP: MEC5-050-01-L-DV-W1-K-TR; Value: *; Availability: Unavailable; Price: None
L1 = Inductor Iron: Magnetic-Core Inductor; Published: 24-Mar-1999; LatestRevisionDate: 17-Jul-2002; LatestRevisionNote: Re-released for DXP Platform.; PackageReference: AXIAL-0.9; Publisher: Altium Limited; PackageDescription: Axial Device, Thru-Hole; 2 Leads; 0.9 in Pin Spacing
L2 L3 = Inductor Iron: Magnetic-Core Inductor; OrderNo: DK 732-6173-1-ND; Published: 24-Mar-1999; LatestRevisionDate: 17-Jul-2002; LatestRevisionNote: Re-released for DXP Platform.; PackageReference: AXIAL-0.9; Publisher: Altium Limited; PackageDescription: Axial Device, Thru-Hole; 2 Leads; 0.9 in Pin Spacing
R2-R10 R13 R14 = Res1: Resistor; Published: 8-Jun-2000; LatestRevisionDate: 17-Jul-2002; LatestRevisionNote: Re-released for DXP Platform.; PackageReference: AXIAL-0.3; Publisher: Altium Limited; PackageDescription: Axial Device, Thru-Hole; 2 Leads; 0.3 in Pin Spacing
R11 R12 = Res: Resistor, SM; OrderNo: RHM.003ALCT-ND; CostEach: 0; Supplier: Digikey
U3 = LTC3636EUFD#PBF: Integrated Circuit; Manufacturer_Name: Analog Devices; Datasheet Link: https://www.arrow.com/en/products/ltc3636eufdpbf/analog-devices; Height: 0.8mm; Manufacturer_Part_Number: LTC3636EUFD#PBF; Mouser Part Number: 584-LTC3636EUFDPBF; Mouser Price/Stock: https://www.mouser.co.uk/ProductDetail/Analog-Devices/LTC3636EUFDPBF?qs=BZBei1rCqCAF%252BjKW6tHubg%3D%3D; Arrow Part Number: LTC3636EUFD#PBF; Arrow Price/Stock: https://www.arrow.com/en/products/ltc3636eufdpbf/analog-devices?region=nac
U4 U5 = AD8202WYRZ: Integrated Circuit; Manufacturer_Name: Analog Devices; OrderNo: AD8202YRZ-R7CT-ND; Datasheet Link: http://www.analog.com/static/imported-files/data_sheets/AD8202.pdf; Height: 1.75mm; Manufacturer_Part_Number: AD8202WYRZ; Mouser Part Number: 584-AD8202WYRZ; Mouser Price/Stock: https://www.mouser.com/Search/Refine.aspx?Keyword=584-AD8202WYRZ; Arrow Part Number: AD8202WYRZ; Arrow Price/Stock: https://www.arrow.com/en/products/ad8202wyrz/analog-devices?region=nac; Supplier: Digikey
U6 = ADS1015LIDGSR: Integrated Circuit; Manufacturer_Name: Texas Instruments; Datasheet Link: https://www.ti.com/lit/ds/symlink/ads1015l.pdf?ts=1755949738915&ref_url=https%253A%252F%252Fwww.google.com%252F; Height: 1.1mm; Manufacturer_Part_Number: ADS1015LIDGSR; Mouser Part Number: 595-ADS1015LIDGSR; Mouser Price/Stock: https://www.mouser.co.uk/ProductDetail/Texas-Instruments/ADS1015LIDGSR?qs=2wMNvWM5ZX4Z9D3W5OO6Eg%3D%3D; Arrow Part Number: ADS1015LIDGSR; Arrow Price/Stock: https://www.arrow.com/en/products/ads1015lidgsr/texas-instruments?utm_currency=USD&region=nac

## Nets that join several sheets
2V5: TP4_Compact_FMC_Sht1 (C2.1 U1.2 U2.6), TP4_Compact_FMC_Sht2 (C22.2 U6.8)
3V3: TP4_Compact_FMC_Sht1 (C1.1 U1.3), TP4_Compact_FMC_Sht2 (10 pins)
GND: TP4_Compact_FMC_Sht1 (254 pins), TP4_Compact_FMC_Sht2 (59 pins)
12V0RAW: TP4_Compact_FMC_Sht1 (5 pins), TP4_Compact_FMC_Sht2 (L1.2 R2.2 R3.2)
DIGITALPIXEL0_B: TP4_Compact_FMC_Sht1 (J1.d26), TP4_Compact_FMC_Sht2 (J2.80)
DIGITALPIXEL0_T: TP4_Compact_FMC_Sht1 (J1.d23), TP4_Compact_FMC_Sht2 (J2.74)
DIGITALPIXEL1_B: TP4_Compact_FMC_Sht1 (J1.d27), TP4_Compact_FMC_Sht2 (J2.82)
DIGITALPIXEL1_T: TP4_Compact_FMC_Sht1 (J1.d24), TP4_Compact_FMC_Sht2 (J2.76)
I2C_SCL: TP4_Compact_FMC_Sht1 (J1.c30), TP4_Compact_FMC_Sht2 (J2.85 U6.10)
I2C_SDA: TP4_Compact_FMC_Sht1 (J1.c31), TP4_Compact_FMC_Sht2 (J2.86 U6.9)
RESET_B_N: TP4_Compact_FMC_Sht1 (J1.d12), TP4_Compact_FMC_Sht2 (J2.75)
RESET_B_P: TP4_Compact_FMC_Sht1 (J1.d11), TP4_Compact_FMC_Sht2 (J2.73)
SC_CLOCK_IN_B_N: TP4_Compact_FMC_Sht1 (J1.c27), TP4_Compact_FMC_Sht2 (J2.63)
SC_CLOCK_IN_B_P: TP4_Compact_FMC_Sht1 (J1.c26), TP4_Compact_FMC_Sht2 (J2.61)
SC_CLOCK_OUT_B_N: TP4_Compact_FMC_Sht1 (J1.d18), TP4_Compact_FMC_Sht2 (J2.64)
SC_CLOCK_OUT_B_P: TP4_Compact_FMC_Sht1 (J1.d17), TP4_Compact_FMC_Sht2 (J2.62)
SC_DATA_IN_B_N: TP4_Compact_FMC_Sht1 (J1.d21), TP4_Compact_FMC_Sht2 (J2.70)
SC_DATA_IN_B_P: TP4_Compact_FMC_Sht1 (J1.d20), TP4_Compact_FMC_Sht2 (J2.68)
SC_DATA_OUT_B_N: TP4_Compact_FMC_Sht1 (J1.d9), TP4_Compact_FMC_Sht2 (J2.69)
SC_DATA_OUT_B_P: TP4_Compact_FMC_Sht1 (J1.d8), TP4_Compact_FMC_Sht2 (J2.67)
SERIAL_OUT0_B_N: TP4_Compact_FMC_Sht1 (J1.b17), TP4_Compact_FMC_Sht2 (J2.29)
SERIAL_OUT0_B_P: TP4_Compact_FMC_Sht1 (J1.b16), TP4_Compact_FMC_Sht2 (J2.27)
SERIAL_OUT0_T_N: TP4_Compact_FMC_Sht1 (J1.c7), TP4_Compact_FMC_Sht2 (J2.5)
SERIAL_OUT0_T_P: TP4_Compact_FMC_Sht1 (J1.c6), TP4_Compact_FMC_Sht2 (J2.3)
SERIAL_OUT1_B_N: TP4_Compact_FMC_Sht1 (J1.b13), TP4_Compact_FMC_Sht2 (J2.24)
SERIAL_OUT1_B_P: TP4_Compact_FMC_Sht1 (J1.b12), TP4_Compact_FMC_Sht2 (J2.22)
SERIAL_OUT1_T_N: TP4_Compact_FMC_Sht1 (J1.a3), TP4_Compact_FMC_Sht2 (J2.11)
SERIAL_OUT1_T_P: TP4_Compact_FMC_Sht1 (J1.a2), TP4_Compact_FMC_Sht2 (J2.9)
SERIAL_OUT2_B_N: TP4_Compact_FMC_Sht1 (J1.b9), TP4_Compact_FMC_Sht2 (J2.35)
SERIAL_OUT2_B_P: TP4_Compact_FMC_Sht1 (J1.b8), TP4_Compact_FMC_Sht2 (J2.33)
SERIAL_OUT2_T_N: TP4_Compact_FMC_Sht1 (J1.a7), TP4_Compact_FMC_Sht2 (J2.6)
SERIAL_OUT2_T_P: TP4_Compact_FMC_Sht1 (J1.a6), TP4_Compact_FMC_Sht2 (J2.4)
SERIAL_OUT3_B_N: TP4_Compact_FMC_Sht1 (J1.b5), TP4_Compact_FMC_Sht2 (J2.23)
SERIAL_OUT3_B_P: TP4_Compact_FMC_Sht1 (J1.b4), TP4_Compact_FMC_Sht2 (J2.21)
SERIAL_OUT3_T_N: TP4_Compact_FMC_Sht1 (J1.a11), TP4_Compact_FMC_Sht2 (J2.17)
SERIAL_OUT3_T_P: TP4_Compact_FMC_Sht1 (J1.a10), TP4_Compact_FMC_Sht2 (J2.15)
SERIAL_OUT4_B_N: TP4_Compact_FMC_Sht1 (J1.y11), TP4_Compact_FMC_Sht2 (J2.18)
SERIAL_OUT4_B_P: TP4_Compact_FMC_Sht1 (J1.y10), TP4_Compact_FMC_Sht2 (J2.16)
SERIAL_OUT4_T_N: TP4_Compact_FMC_Sht1 (J1.a15), TP4_Compact_FMC_Sht2 (J2.12)
SERIAL_OUT4_T_P: TP4_Compact_FMC_Sht1 (J1.a14), TP4_Compact_FMC_Sht2 (J2.10)
SERIAL_OUT5_B_N: TP4_Compact_FMC_Sht1 (J1.z13), TP4_Compact_FMC_Sht2 (J2.36)
SERIAL_OUT5_B_P: TP4_Compact_FMC_Sht1 (J1.z12), TP4_Compact_FMC_Sht2 (J2.34)
SERIAL_OUT5_T_N: TP4_Compact_FMC_Sht1 (J1.a19), TP4_Compact_FMC_Sht2 (J2.30)
SERIAL_OUT5_T_P: TP4_Compact_FMC_Sht1 (J1.a18), TP4_Compact_FMC_Sht2 (J2.28)
SHUTTER_B_N: TP4_Compact_FMC_Sht1 (J1.c23), TP4_Compact_FMC_Sht2 (J2.42)
SHUTTER_B_P: TP4_Compact_FMC_Sht1 (J1.c22), TP4_Compact_FMC_Sht2 (J2.40)
SPARE0: TP4_Compact_FMC_Sht1 (J1.g9), TP4_Compact_FMC_Sht2 (J2.46)
SPARE1: TP4_Compact_FMC_Sht1 (J1.g10), TP4_Compact_FMC_Sht2 (J2.48)
SPARE2: TP4_Compact_FMC_Sht1 (J1.g12), TP4_Compact_FMC_Sht2 (J2.52)
SPARE3: TP4_Compact_FMC_Sht1 (J1.g13), TP4_Compact_FMC_Sht2 (J2.54)
TESTOUT_B_N: TP4_Compact_FMC_Sht1 (J1.c15), TP4_Compact_FMC_Sht2 (J2.47)
TESTOUT_B_P: TP4_Compact_FMC_Sht1 (J1.c14), TP4_Compact_FMC_Sht2 (J2.45)
TESTOUT_T_N: TP4_Compact_FMC_Sht1 (J1.c19), TP4_Compact_FMC_Sht2 (J2.53)
TESTOUT_T_P: TP4_Compact_FMC_Sht1 (J1.c18), TP4_Compact_FMC_Sht2 (J2.51)
TO_SYNC_B_N: TP4_Compact_FMC_Sht1 (J1.d15), TP4_Compact_FMC_Sht2 (J2.81)
TO_SYNC_B_P: TP4_Compact_FMC_Sht1 (J1.d14), TP4_Compact_FMC_Sht2 (J2.79)
TPX4_RefClk_N: TP4_Compact_FMC_Sht1 (J1.c11), TP4_Compact_FMC_Sht2 (J2.41)
TPX4_RefClk_P: TP4_Compact_FMC_Sht1 (J1.c10), TP4_Compact_FMC_Sht2 (J2.39)